# Altium schematic sheet Schematic1.SchDoc
size A4; SchematicName: Schematic1
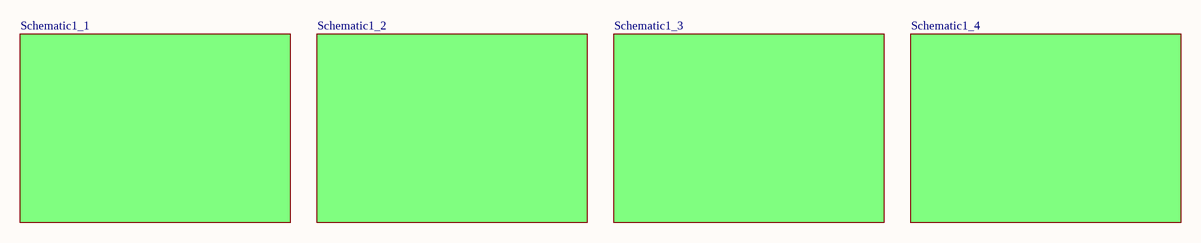
[diagram p0: Schematic1.SchDoc]

## Sub-sheets
Schematic1_1 = Schematic1_1.SchDoc: no entries
Schematic1_2 = Schematic1_2.SchDoc: no entries
Schematic1_3 = Schematic1_3.SchDoc: no entries
Schematic1_4 = Schematic1_4.SchDoc: no entries